# Altium project HeartLED.PrjPcb
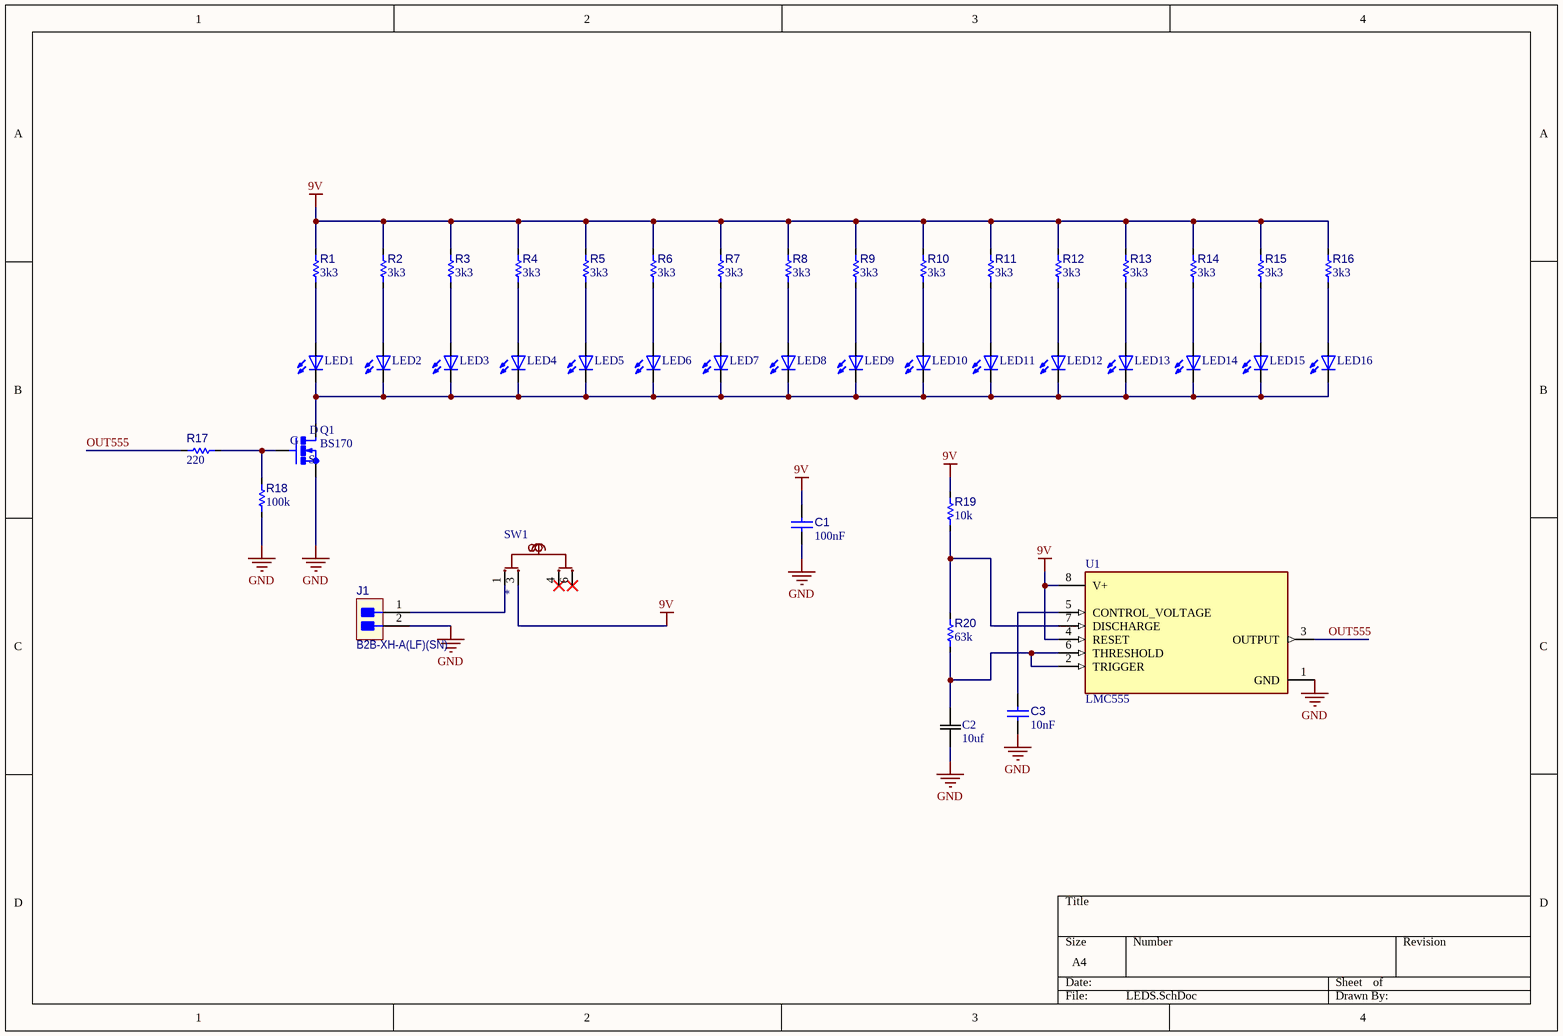
[diagram p0: LEDS.SchDoc]
1 sheet, 43 parts. Net scope: global (net labels, ports and power ports of the same name join across sheets).
Board file: PCB1.PcbDoc

## Sheet LEDS.SchDoc
size A4; SheetNumber: 1; SheetTotal: 1

### Parts
C1  value 100nF  [C_1608[0603]]  (hidden comment: CAP CER 100nF 50V 0603)
C2  10uf  [CAP_PKPZ_5X11_LOW_RUB]
C3  value 10nF  [C_1608[0603]]  (hidden comment: CAP CER 100nF 50V 0603)
J1  B2B-XH-A(LF)(SN)  [J_B2B-XH-A_LF_JST]
LED1  TLLR4400  [LED3MM]  (value not drawn)
LED2  TLLR4400  [LED3MM]  (value not drawn)
LED3  TLLR4400  [LED3MM]  (value not drawn)
LED4  TLLR4400  [LED3MM]  (value not drawn)
LED5  TLLR4400  [LED3MM]  (value not drawn)
LED6  TLLR4400  [LED3MM]  (value not drawn)
LED7  TLLR4400  [LED3MM]  (value not drawn)
LED8  TLLR4400  [LED3MM]  (value not drawn)
LED9  TLLR4400  [LED3MM]  (value not drawn)
LED10  TLLR4400  [LED3MM]  (value not drawn)
LED11  TLLR4400  [LED3MM]  (value not drawn)
LED12  TLLR4400  [LED3MM]  (value not drawn)
LED13  TLLR4400  [LED3MM]  (value not drawn)
LED14  TLLR4400  [LED3MM]  (value not drawn)
LED15  TLLR4400  [LED3MM]  (value not drawn)
LED16  TLLR4400  [LED3MM]  (value not drawn)
Q1  BS170  [TO92127P478H483-3]
R1  value 3k3  [R_1608[0603]]  (hidden comment: Res 10k 1% 0603)
R2  value 3k3  [R_1608[0603]]  (hidden comment: Res 10k 1% 0603)
R3  value 3k3  [R_1608[0603]]  (hidden comment: Res 10k 1% 0603)
R4  value 3k3  [R_1608[0603]]  (hidden comment: Res 10k 1% 0603)
R5  value 3k3  [R_1608[0603]]  (hidden comment: Res 10k 1% 0603)
R6  value 3k3  [R_1608[0603]]  (hidden comment: Res 10k 1% 0603)
R7  value 3k3  [R_1608[0603]]  (hidden comment: Res 10k 1% 0603)
R8  value 3k3  [R_1608[0603]]  (hidden comment: Res 10k 1% 0603)
R9  value 3k3  [R_1608[0603]]  (hidden comment: Res 10k 1% 0603)
R10  value 3k3  [R_1608[0603]]  (hidden comment: Res 10k 1% 0603)
R11  value 3k3  [R_1608[0603]]  (hidden comment: Res 10k 1% 0603)
R12  value 3k3  [R_1608[0603]]  (hidden comment: Res 10k 1% 0603)
R13  value 3k3  [R_1608[0603]]  (hidden comment: Res 10k 1% 0603)
R14  value 3k3  [R_1608[0603]]  (hidden comment: Res 10k 1% 0603)
R15  value 3k3  [R_1608[0603]]  (hidden comment: Res 10k 1% 0603)
R16  value 3k3  [R_1608[0603]]  (hidden comment: Res 10k 1% 0603)
R17  value 220  [R_1608[0603]]  (hidden comment: Res 10k 1% 0603)
R18  value 100k  [R_1608[0603]]  (hidden comment: Res 10k 1% 0603)
R19  value 10k  [R_1608[0603]]  (hidden comment: Res 10k 1% 0603)
R20  value 63k  [R_1608[0603]]  (hidden comment: Res 10k 1% 0603)
SW1  CST10T2CR  [CST10T2CR]  (value not drawn)
U1  LMC555  [SOIC127P599X175-8N]

### Nets
9V: C1.2 R1.2 R2.2 R3.2 R4.2 R5.2 R6.2 R7.2 R8.2 R9.2 R10.2 R11.2 R12.2 R13.2 R14.2 R15.2 R16.2 R19.2 SW1.3 U1.4(RESET) U1.8(V+)
GND: C1.1 C2.2 C3.1 J1.2 Q1.3(S) R18.1 U1.1(GND)
OUT555: R17.2 U1.3(OUTPUT)
NetC2_1: C2.1 R20.1 U1.2(TRIGGER) U1.6(THRESHOLD)
NetC3_2: C3.2 U1.5(CONTROL_VOLTAGE)
NetJ1_1: J1.1 SW1.1
NetLED1_A: LED1.A R1.1
NetLED1_K: LED1.K(C) LED2.K(C) LED3.K(C) LED4.K(C) LED5.K(C) LED6.K(C) LED7.K(C) LED8.K(C) LED9.K(C) LED10.K(C) LED11.K(C) LED12.K(C) LED13.K(C) LED14.K(C) LED15.K(C) LED16.K(C) Q1.1(D)
NetLED2_A: LED2.A R2.1
NetLED3_A: LED3.A R3.1
NetLED4_A: LED4.A R4.1
NetLED5_A: LED5.A R5.1
NetLED6_A: LED6.A R6.1
NetLED7_A: LED7.A R7.1
NetLED8_A: LED8.A R8.1
NetLED9_A: LED9.A R9.1
NetLED10_A: LED10.A R10.1
NetLED11_A: LED11.A R11.1
NetLED12_A: LED12.A R12.1
NetLED13_A: LED13.A R13.1
NetLED14_A: LED14.A R14.1
NetLED15_A: LED15.A R15.1
NetLED16_A: LED16.A R16.1
NetQ1_2: Q1.2(G) R17.1 R18.2
NetR19_1: R19.1 R20.2 U1.7(DISCHARGE)

Not connected (* = marked no-connect by the designer): SW1 4* 6*

### Library data of the parts
C1 C3 = CAP002: Capacitor type 1; Manufacturer 1: Yageo; Manufacturer Part Number 1: CC0603KRX7R9BB104; LibRef: CAP002; Code CEGEP: COND0143SM; Tolerance: 10%; Dielectric: X7R; Rated Voltage: 50V; Mounting Technology: SMT; Supplier 1: LCSC; Supplier Part Number 1: C14663
C2 = 50PK10MEFC5X11: Description; Manufacturer_Name: Rubycon; Copyright: Copyright (C) 2025 Ultra Librarian. All rights reserved.; Manufacturer_Part_Number: 50PK10MEFC5X11
J1 = CONN-2MM-01X02-B2B: Conn. 2 pins JST B2B TH Straight 2mm; Value: Conn_01x02 TH; Manufacturer 1: JST; Manufacturer Part Number 1: B2B-XH-A(LF)(SN); Mounting Technology: SMT; Supplier 1: LCSC; Supplier 2: Farnell; Supplier Part Number 1: C158012; Supplier Part Number 2: 1516276
LED1-LED16 = TLLR4400: Red 619nm LED Indication - Discrete 1.9V Radial; MF: Vishay; SnapEDA_Link: https://www.snapeda.com/parts/TLLR4400/Vishay+Semiconductor+Opto+Division/view-part/?ref=snap; Package: None; Value: *; MP: TLLR4400; Check_prices: https://www.snapeda.com/parts/TLLR4400/Vishay+Semiconductor+Opto+Division/view-part/?ref=eda
Q1 = BS170: N-Channel 60 V 500mA (Ta) 830mW (Ta) Through Hole TO-92-3; MANUFACTURER: ON; Package: Package; MPN: BS170; DATASHEET_URL: https://s3.amazonaws.com/snapeda/datasheet/BS170_NTE_Electronics-_Inc.pdf; Value: *; SOURCE_URL: https://www.snapeda.com/parts/BS170/Onsemi/view-part/
R1-R20 = RES001: Resistor type 1; Manufacturer 1: Yageo; Manufacturer Part Number 1: RC0603FR-0710KL; LibRef: RES001; Code CEGEP: RESI0238-0603; Puissance: 1/10W; Max Working Voltage: 75V; Tolerance: 1%; Mounting Technology: SMT; Supplier 1: LCSC; Supplier Part Number 1: C98220
SW1 = CST10T2CR: Toggle Switches. CST10T2CR; Manufacturer: CIT Relay and Switch; Component Type: Switches; Design Item ID: CST10T2CR; Value: *; JLCPCB Part #: C4949894; Manufacturer Part Number: CST10T2CR
U1 = LM555CM/NOPB: Highly Stable 555 Timer; MF: Texas Instruments; SnapEDA_Link: https://www.snapeda.com/parts/LM555CM/NOPB/Texas+Instruments/view-part/?ref=snap; Package: SOIC-8 Texas Instruments; Value: *; MP: LM555CM/NOPB; Check_prices: https://www.snapeda.com/parts/LM555CM/NOPB/Texas+Instruments/view-part/?ref=eda